# Altium schematic sheet Power.SchDoc: Power - eFuse, Power Mux, Buck, Sensor LDO
size A3; ApprovedBy: Weymen Koo; CheckedBy: -; DrawnBy: Weymen Koo; DocumentNumber: UBCAD-FCSOM-SCH; Revision: A; SheetNumber: 2; SheetTotal: 18; ProjectTitle: Flight Controller SoM; Status: PRELIMINARY; ReleaseDate: 2026-11-14
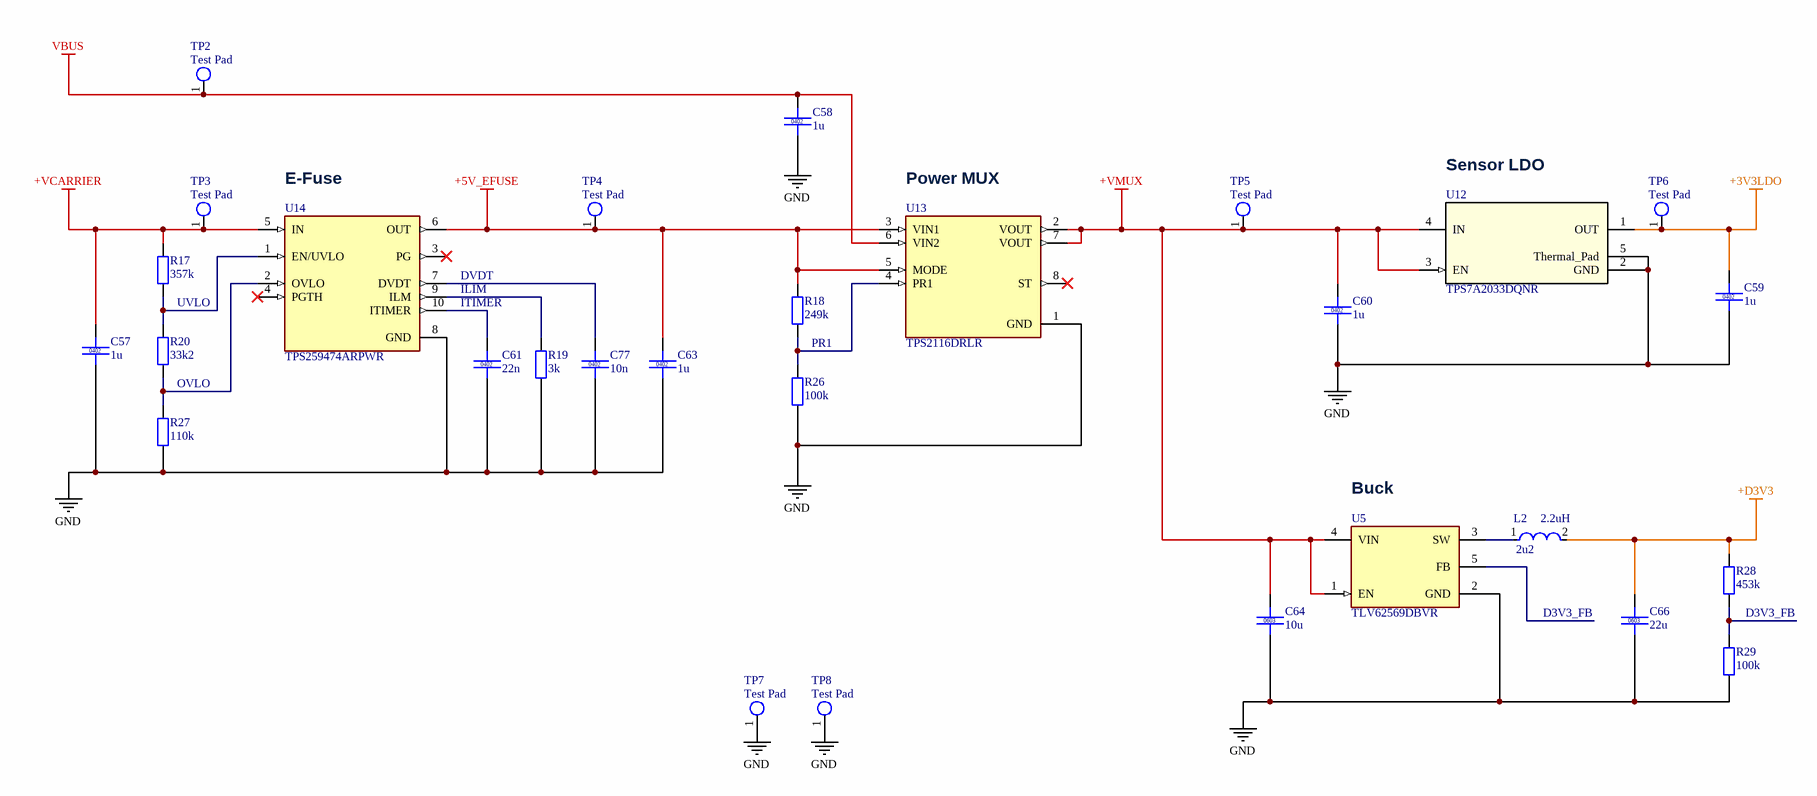
[diagram p0: Power.SchDoc]

## Parts
C57  1u  [CAPC1005X05N]
C58  1u  [CAPC1005X05N]
C59  1u  [CAPC1005X05N]
C60  1u  [CAPC1005X05N]
C61  22n  [CAPC1005X05N]
C63  1u  [CAPC1005X05N]
C64  10u  [CAPC1608X08N]
C66  22u  [CAPC1608X08N]
C77  10n  [CAPC1005X05N]
L2  2u2  Inductance: 2.2uH  [FP-DFE252012C-IPC_B]
R17  357k  [IPC C R0402 NO SILK]
R18  249k  [IPC C R0402 NO SILK]
R19  3k  [IPC C R0402 NO SILK]
R20  33k2  [IPC C R0402 NO SILK]
R26  100k  [IPC C R0402 NO SILK]
R27  110k  [IPC C R0402 NO SILK]
R28  453k  [IPC C R0402 NO SILK]
R29  100k  [IPC C R0402 NO SILK]
TP2  Test Pad  [PCBComponent_1]
TP3  Test Pad  [PCBComponent_1]
TP4  Test Pad  [PCBComponent_1]
TP5  Test Pad  [PCBComponent_1]
TP6  Test Pad  [PCBComponent_1]
TP7  Test Pad  [PCBComponent_1]
TP8  Test Pad  [PCBComponent_1]
U5  TLV62569DBVR  [FP-DBV0005A-MFG]
U12  TPS7A2033DQNR  [DQN0004A-MFG]
U13  TPS2116DRLR  [SOTFL50P160X60-8N]
U14  TPS259474ARPWR  [IC_TPS259474ARPWR]

## Nets
+3V3LDO: C59.1 TP6.1 U12.1(OUT)
+5V_EFUSE: C63.1 R18.2 TP4.1 U13.3(VIN1) U13.5(MODE) U14.6(OUT)
+D3V3: C66.1 L2.2 R28.2
+VCARRIER: C57.1 R17.2 TP3.1 U14.5(IN)
+VMUX: C60.1 C64.1 TP5.1 U5.1(EN) U5.4(VIN) U12.3(EN) U12.4(IN) U13.2(VOUT) U13.7(VOUT)
GND: C57.2 C58.2 C59.2 C60.2 C61.2 C63.2 C64.2 C66.2 C77.2 R19.2 R26.1 R27.1 R29.1 TP7.1 TP8.1 U5.2(GND) U12.2(GND) U12.5(Thermal_Pad) U13.1(GND) U14.8(GND)
VBUS: C58.1 TP2.1 U13.6(VIN2)
D3V3_FB: R28.1 R29.2 U5.5(FB)
DVDT: C77.1 U14.7(DVDT)
ILIM: R19.1 U14.9(ILM)
ITIMER: C61.1 U14.10(ITIMER)
OVLO: R20.1 R27.2 U14.2(OVLO)
PR1: R18.1 R26.2 U13.4(PR1)
UVLO: R17.1 R20.2 U14.1(EN/UVLO)
NetL2_1: L2.1 U5.3(SW)

Not connected (* = marked no-connect by the designer): U13 8(ST)*; U14 3(PG)* 4(PGTH)*

## Notes on the sheet
- (near U14) E-Fuse
- (near U13) Power MUX
- Sensor LDO
- (near U5) Buck
- PROJECT
- KEY
- POWER
- 5 V class
- 3.3 V class
- Core / SMPS
- GND
- SHEET TITLE
- SIGNALS
- NOTES
- SPI
- Analog
- Design
- I2C
- PWM/Timer
- Layout
- UART/RC
- GPIO/Ctrl
- Assembly
- CAN
- Unused pin
- Firmware
- USB/SD/Clk
- Critical
- DRAWN
- DOCUMENT NO.
- CHECKED
- REV
- STATUS
- APPROVED
- DATE
- FILE
- SIZE
- A3
- SHEET
- of

## Library data of the parts
C57-C60 C63 = CMP-002-000094-5: CAP 1u 25V X5R 10% 0402; Manufacturer: Samsung; Manufacturer Part Number: CL05A105KA5NQNC; Value: 1u; Tolerance: 10%; Package: 0402; Voltage: 25V; Dielectric: X5R; LCSC Part #: C52923
C61 = CMP-002-000094-5: CAP 22n 50V X7R 10% 0402; Manufacturer: FH; Manufacturer Part Number: 0402B223K500NT; Value: 22n; Tolerance: 10%; Package: 0402; Voltage: 50V; Dielectric: X7R; LCSC Part #: C1532
C64 = CMP-002-000095-4: CAP 10u 25V X5R 20% 0603; Manufacturer: Samsung; Manufacturer Part Number: CL10A106MA8NRNC; Value: 10u; Tolerance: 20%; Package: 0603; Voltage: 25V; Dielectric: X5R; LCSC Part #: C96446
C66 = CMP-002-000095-4: CAP 22u 6.3V X5R 20% 0603; Manufacturer: Samsung; Manufacturer Part Number: CL10A226MQ8NRNC; Value: 22u; Tolerance: 20%; Package: 0603; Voltage: 6.3V; Dielectric: X5R; LCSC Part #: C59461
C77 = CMP-002-000094-5: CAP 10n 50V X7R 10% 0402; Manufacturer: Samsung; Manufacturer Part Number: CL05B103KB5NNNC; Value: 10n; Tolerance: 10%; Package: 0402; Voltage: 50V; Dielectric: X7R; LCSC Part #: C15195
L2 = CMP-06042-014676-1: Shielded Wirewound Inductor 2.2uH 20% 2300mA 0.082Ω 1008 (2520); Manufacturer: Murata; Manufacturer Part Number: DFE252012F-2R2M=P2; DC Resistance (DCR): 82mR; Test Frequency: 1MHz; Saturation Current: 3.6A; Core Material: Ferrite; Current Rating: 2.3A; Case/Package: 1008; Tolerance: 20%; Max Operating Temperature: 125°C; Shielding: Shielded; Height - Seated (Max): 0.047inch; Packaging: Tape and Reel; Min Operating Temperature: -40°C; Length: 0.098inch; Width: 0.079inch; Case Code (Imperial): 1008; Mount: Surface Mount; Case Code (Metric): 2520; Value: 2u2; Package: 2520
R17 = CMP-008-000000-2: RES 357k 1% 1/16W 0402; Manufacturer: UNI-ROYAL; Manufacturer Part Number: 0402WGF3573TCE; Value: 357k; Source: Schlib1.SchLib; Design Item ID: Generic RES 0402; Package: 0402; Tolerance: 1%; Power: 1/16W; LCSC Part #: C27005
R18 = CMP-008-000000-2: RES 249k 1% 1/16W 0402; Manufacturer: UNI-ROYAL; Manufacturer Part Number: 0402WGF2493TCE; Value: 249k; Source: Schlib1.SchLib; Design Item ID: Generic RES 0402; Package: 0402; Tolerance: 1%; Power: 1/16W
R19 = CMP-008-000000-2: RES 3k 1% 1/16W 0402; Manufacturer: UNI-ROYAL; Manufacturer Part Number: 0402WGF3001TCE; Value: 3k; Source: Schlib1.SchLib; Design Item ID: Generic RES 0402; Package: 0402; Tolerance: 1%; Power: 1/16W; LCSC Part #: C25784
R20 = CMP-008-000000-2: RES 33k2 1% 1/16W 0402; Manufacturer: UNI-ROYAL; Manufacturer Part Number: 0402WGF3322TCE; Value: 33k2; Source: Schlib1.SchLib; Design Item ID: Generic RES 0402; Package: 0402; Tolerance: 1%; Power: 1/16W; LCSC Part #: C122548
R26 R29 = CMP-008-000000-2: RES 100k 1% 1/16W 0402; Manufacturer: UNI-ROYAL; Manufacturer Part Number: 0402WGF1003TCE; Value: 100k; Source: Schlib1.SchLib; Design Item ID: Generic RES 0402; Package: 0402; Tolerance: 1%; Power: 1/16W; LCSC Part #: C25741
R27 = CMP-008-000000-2: RES 110k 1% 1/16W 0402; Manufacturer: UNI-ROYAL; Manufacturer Part Number: 0402WGF1103TCE; Value: 110k; Source: Schlib1.SchLib; Design Item ID: Generic RES 0402; Package: 0402; Tolerance: 1%; Power: 1/16W
R28 = CMP-008-000000-2: RES 453k 1% 1/16W 0402; Manufacturer: Walsin; Manufacturer Part Number: WR04X4533FTL; Value: 453k; Source: Schlib1.SchLib; Design Item ID: Generic RES 0402; Package: 0402; Tolerance: 1%; Power: 1/16W; LCSC Part #: C170322
TP2-TP8 = CMP-092-000000-4: Design Item ID: TP; Source: Testpoint.SchLib
U5 = CMP-04918-000387-1: IC REG BUCK ADJ 2A SOT23-5; Output Configuration: Positive; Min Output Voltage: 600mV; Max Output Voltage: 5.5V; Switching Frequency: 1.5MHz; Output Type: Adjustable; Synchronous Rectifier: Yes; Min Input Voltage: 2.5V; Output Current: 2A; Mount: Surface Mount; Min Operating Temperature: -40°C; Max Operating Temperature: 125°C; RoHS Compliant: Yes; Max Input Voltage: 5.5V; Case/Package: SOT-23-5; Packaging: Cut Tape
U12 = CMP-341-000000-2: 300mA ultra-low-noise low-IQ low-dropout (LDO) linear regulator with high PSRR 4-X2SON -40 to 125; Manufacturer_Name: Texas Instruments; Design Item ID: TPS7A2033DQNR; Source: TPS7A2033DQNR.SchLib; RefDes: RefDes; TYPE: TYPE; Copyright: Copyright (C) 2025 Ultra Librarian. All rights reserved.; Manufacturer_Part_Number: TPS7A2033DQNR
U13 = CMP-110-000001-1: Power mux, 1.6 V to 5.5 V, 2.5 A, priority select; MF: Texas Instruments; Package: None; Value: *; Design Item ID: TPS2116DRLR; Check_prices: https://www.snapeda.com/parts/TPS2116DRLR/Texas+Instruments/view-part/?ref=eda; Source: TPS2116DRLR.SchLib; SnapEDA_Link: https://www.snapeda.com/parts/TPS2116DRLR/Texas+Instruments/view-part/?ref=snap; Pin Count: 8; MP: TPS2116DRLR; Component Type: Standard
U14 = CMP-334-000000-1: eFuse, 2.7 V to 23 V, 5.5 A, reverse current blocking; MF: Texas Instruments; Pin Count: 10; MP: TPS259474ARPWR; Source: TPS259474ARPWR.SchLib; Value: *; Component Type: Standard; Design Item ID: TPS259474ARPWR; Check_prices: https://www.snapeda.com/parts/TPS259474ARPWR/Texas+Instruments/view-part/?ref=eda; Package: VFQFN-10 Texas Instruments; SnapEDA_Link: https://www.snapeda.com/parts/TPS259474ARPWR/Texas+Instruments/view-part/?ref=snap